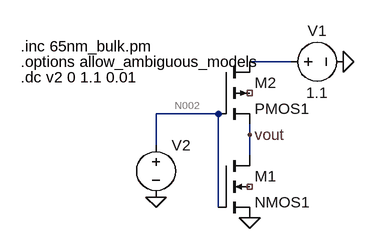
[diagram p0: schematic circuit.asc]
circuit.asc, the LTspice schematic file:
Version 4.1
SHEET 1 880 680
WIRE 304 -80 240 -80
WIRE 192 0 96 0
WIRE 240 32 240 16
WIRE 96 48 96 0
WIRE 240 64 240 32
WIRE 192 144 192 0
FLAG 96 128 0
FLAG 384 -80 0
FLAG 240 160 0
FLAG 240 32 vout
SYMBOL nmos4 192 64 R0
SYMATTR InstName M1
SYMATTR Value NMOS1
SYMATTR Value2 l=65nm w=1um
SYMBOL pmos4 192 -80 R0
SYMATTR InstName M2
SYMATTR Value PMOS1
SYMATTR Value2 l=65nm w=2um
SYMBOL voltage 288 -80 R270
WINDOW 0 32 56 VTop 2
WINDOW 3 -32 56 VBottom 2
WINDOW 123 0 0 Left 0
WINDOW 39 0 0 Left 0
SYMATTR InstName V1
SYMATTR Value 1.1
SYMBOL voltage 96 32 R0
WINDOW 123 0 0 Left 0
WINDOW 39 0 0 Left 0
SYMATTR InstName V2
SYMATTR Value ""
TEXT -112 -104 Left 2 !.inc 65nm_bulk.pm
TEXT -112 -80 Left 2 !.options allow_ambiguous_models
TEXT -112 -56 Left 2 !.dc v2 0 1.1 0.01

The netlist it stands for:
* circuit.asc
M1 vout N002 0 NC_01 NMOS1 l=65nm w=1um
M2 N001 N002 vout NC_02 PMOS1 l=65nm w=2um
V1 N001 0 1.1
V2 N002 0
.model NMOS NMOS
.model PMOS PMOS
.lib standard.mos
.inc 65nm_bulk.pm
.options allow_ambiguous_models
.dc v2 0 1.1 0.01
.backanno
.end

* Results of the author's LTspice run, read from the files saved beside the schematic
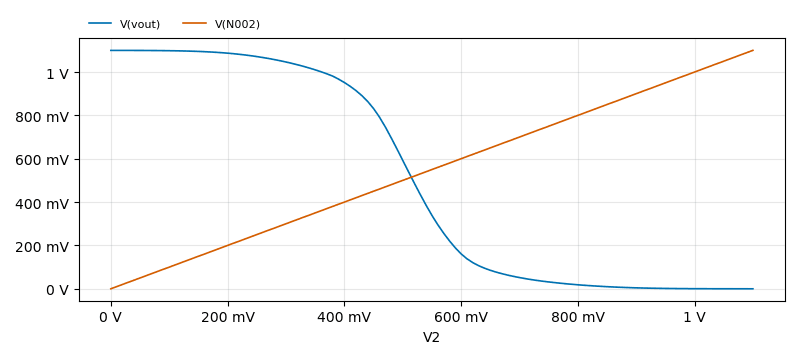
[diagram p1: DC transfer characteristic of circuit.asc, plotted from the saved traces]
* DC transfer characteristic, 1 run:
*   V(vout): 1.1 V at V2=0 V, 52.19 µV at V2=1.1 V, min 52.19 µV, max 1.1 V
*   V(N002): 0 V at V2=0 V, 1.1 V at V2=1.1 V, min 0 V, max 1.1 V